# EAGLE schematic apu (EAGLE 9.6.2)
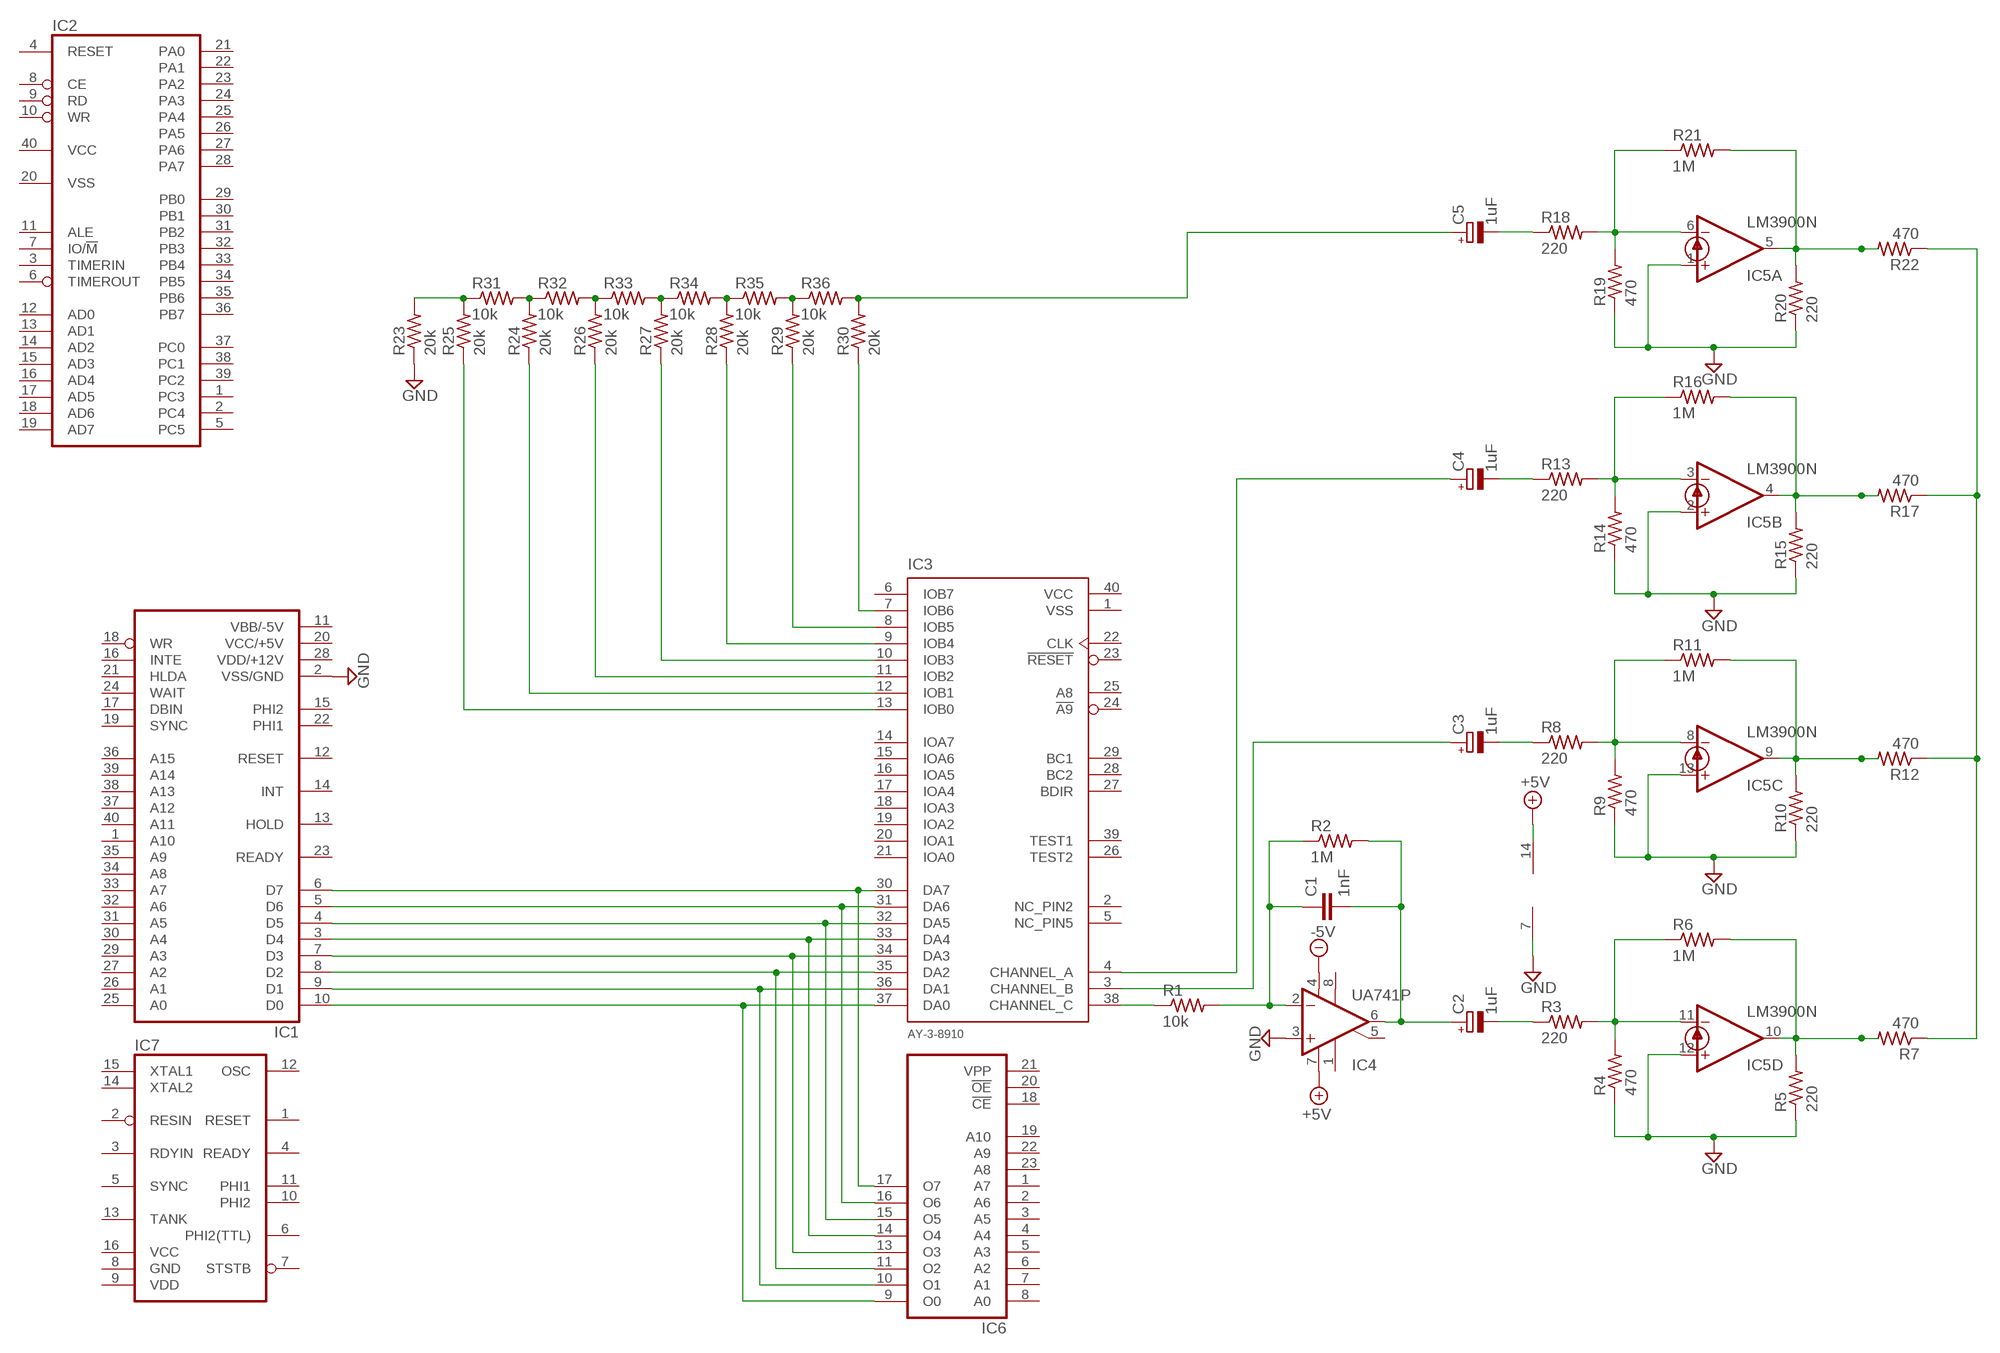
[diagram p0: schematic, sheet 1]

## Parts
C1  1nF  C-EU025-025X050  [C025-025X050]
C2  1uF  CPOL-EUE1.8-4  [E1,8-4]
C3  1uF  CPOL-EUE1.8-4  [E1,8-4]
C4  1uF  CPOL-EUE1.8-4  [E1,8-4]
C5  1uF  CPOL-EUE1.8-4  [E1,8-4]
IC1  8080  [DIL40]
IC2  8155  [DIL40]
IC3  AY-3-8910  [DIL40]
IC4  UA741P  [DIL08]
IC5  LM3900N  [DIL14]
IC6  2716  [DIL24]
IC7  8224  [DIL16]
R1  10k  R-US_0207/10  [0207/10]
R2  1M  R-US_0207/10  [0207/10]
R3  220  R-US_0207/10  [0207/10]
R4  470  R-US_0207/10  [0207/10]
R5  220  R-US_0207/10  [0207/10]
R6  1M  R-US_0207/10  [0207/10]
R7  470  R-US_0207/10  [0207/10]
R8  220  R-US_0207/10  [0207/10]
R9  470  R-US_0207/10  [0207/10]
R10  220  R-US_0207/10  [0207/10]
R11  1M  R-US_0207/10  [0207/10]
R12  470  R-US_0207/10  [0207/10]
R13  220  R-US_0207/10  [0207/10]
R14  470  R-US_0207/10  [0207/10]
R15  220  R-US_0207/10  [0207/10]
R16  1M  R-US_0207/10  [0207/10]
R17  470  R-US_0207/10  [0207/10]
R18  220  R-US_0207/10  [0207/10]
R19  470  R-US_0207/10  [0207/10]
R20  220  R-US_0207/10  [0207/10]
R21  1M  R-US_0207/10  [0207/10]
R22  470  R-US_0207/10  [0207/10]
R23  20k  R-US_0207/10  [0207/10]
R24  20k  R-US_0207/10  [0207/10]
R25  20k  R-US_0207/10  [0207/10]
R26  20k  R-US_0207/10  [0207/10]
R27  20k  R-US_0207/10  [0207/10]
R28  20k  R-US_0207/10  [0207/10]
R29  20k  R-US_0207/10  [0207/10]
R30  20k  R-US_0207/10  [0207/10]
R31  10k  R-US_0207/10  [0207/10]
R32  10k  R-US_0207/10  [0207/10]
R33  10k  R-US_0207/10  [0207/10]
R34  10k  R-US_0207/10  [0207/10]
R35  10k  R-US_0207/10  [0207/10]
R36  10k  R-US_0207/10  [0207/10]

## Nets
+5V: IC4.7(V+) IC5.14(P:V+)
-5V: IC4.4(V-)
GND: IC1.2(VSS/GND) IC4.3(+IN) IC5.1(A:+IN) IC5.2(B:+IN) IC5.7(P:GND) IC5.12(D:+IN) IC5.13(C:+IN) R4.1 R5.1 R9.1 R10.1 R14.1 R15.1 R19.1 R20.1 R23.1
N$1: C1.1 IC4.2(-IN) R1.2 R2.1
N$2: IC3.38(CHANNEL_C) R1.1
N$3: C1.2 C2.+ IC4.6(OUT) R2.2
N$4: C2.- R3.1
N$5: IC5.11(D:-IN) R3.2 R4.2 R6.1
N$6: C3.- R8.1
N$7: IC5.10(D:OUT) R5.2 R6.2 R7.2
N$8: IC5.8(C:-IN) R8.2 R9.2 R11.1
N$9: IC5.9(C:OUT) R10.2 R11.2 R12.2
N$10: C4.- R13.1
N$11: IC5.3(B:-IN) R13.2 R14.2 R16.1
N$12: IC5.4(B:OUT) R15.2 R16.2 R17.2
N$13: C5.- R18.1
N$14: IC5.6(A:-IN) R18.2 R19.2 R21.1
N$15: IC5.5(A:OUT) R20.2 R21.2 R22.2
N$16: C3.+ IC3.3(CHANNEL_B)
N$17: R23.2 R25.2 R31.1
N$18: C4.+ IC3.4(CHANNEL_A)
N$19: R7.1 R12.1 R17.1 R22.1
N$20: IC3.13(IOB0) R25.1
N$21: R24.2 R31.2 R32.1
N$22: R26.2 R32.2 R33.1
N$23: R27.2 R33.2 R34.1
N$24: R28.2 R34.2 R35.1
N$25: R29.2 R35.2 R36.1
N$31: IC1.10(D0) IC3.37(DA0) IC6.9(O0)
N$32: C5.+ R30.2 R36.2
N$33: IC3.12(IOB1) R24.1
N$34: IC3.11(IOB2) R26.1
N$35: IC3.10(IOB3) R27.1
N$36: IC3.9(IOB4) R28.1
N$37: IC3.8(IOB5) R29.1
N$38: IC3.7(IOB6) R30.1
N$39: IC1.9(D1) IC3.36(DA1) IC6.10(O1)
N$40: IC1.8(D2) IC3.35(DA2) IC6.11(O2)
N$41: IC1.7(D3) IC3.34(DA3) IC6.13(O3)
N$42: IC1.3(D4) IC3.33(DA4) IC6.14(O4)
N$43: IC1.4(D5) IC3.32(DA5) IC6.15(O5)
N$44: IC1.5(D6) IC3.31(DA6) IC6.16(O6)
N$45: IC1.6(D7) IC3.30(DA7) IC6.17(O7)
Unconnected: IC1.1(A10) IC1.12(RESET) IC1.13(HOLD) IC1.14(INT) IC1.15(PHI2) IC1.16(INTE) IC1.17(DBIN) IC1.18(WR) IC1.19(SYNC) IC1.21(HLDA) IC1.22(PHI1) IC1.23(READY) IC1.24(WAIT) IC1.25(A0) IC1.26(A1) IC1.27(A2) IC1.29(A3) IC1.30(A4) IC1.31(A5) IC1.32(A6) IC1.33(A7) IC1.34(A8) IC1.35(A9) IC1.36(A15) IC1.37(A12) IC1.38(A13) IC1.39(A14) IC1.40(A11) IC2.1(PC3) IC2.2(PC4) IC2.3(TIMERIN) IC2.4(RESET) IC2.5(PC5) IC2.6(TIMEROUT) IC2.7(IO/!M) IC2.8(CE) IC2.9(RD) IC2.10(WR) IC2.11(ALE) IC2.12(AD0) IC2.13(AD1) IC2.14(AD2) IC2.15(AD3) IC2.16(AD4) IC2.17(AD5) IC2.18(AD6) IC2.19(AD7) IC2.21(PA0) IC2.22(PA1) IC2.23(PA2) IC2.24(PA3) IC2.25(PA4) IC2.26(PA5) IC2.27(PA6) IC2.28(PA7) IC2.29(PB0) IC2.30(PB1) IC2.31(PB2) IC2.32(PB3) IC2.33(PB4) IC2.34(PB5) IC2.35(PB6) IC2.36(PB7) IC2.37(PC0) IC2.38(PC1) IC2.39(PC2) IC3.2(NC_PIN2) IC3.5(NC_PIN5) IC3.6(IOB7) IC3.14(IOA7) IC3.15(IOA6) IC3.16(IOA5) IC3.17(IOA4) IC3.18(IOA3) IC3.19(IOA2) IC3.20(IOA1) IC3.21(IOA0) IC3.22(CLK) IC3.23(!RESET) IC3.24(!A9) IC3.25(A8) IC3.26(TEST2) IC3.27(BDIR) IC3.28(BC2) IC3.29(BC1) IC3.39(TEST1) IC4.1(ON1) IC4.5(ON2) IC4.8(OPT) IC6.1(A7) IC6.2(A6) IC6.3(A5) IC6.4(A4) IC6.5(A3) IC6.6(A2) IC6.7(A1) IC6.8(A0) IC6.18(!CE) IC6.19(A10) IC6.20(!OE) IC6.21(VPP) IC6.22(A9) IC6.23(A8) IC7.1(RESET) IC7.2(RESIN) IC7.3(RDYIN) IC7.4(READY) IC7.5(SYNC) IC7.6(PHI2(TTL)) IC7.7(STSTB) IC7.10(PHI2) IC7.11(PHI1) IC7.12(OSC) IC7.13(TANK) IC7.14(XTAL2) IC7.15(XTAL1)

## Power pins joined to a net without a drawn wire
GND: IC6.12(GND) IC7.8(GND)
VBB/-5V: IC1.11(VBB/-5V)
VCC: IC2.40(VCC) IC3.40(VCC) IC6.24(VCC) IC7.16(VCC)
VCC/+5V: IC1.20(VCC/+5V)
VDD: IC7.9(VDD)
VDD/+12V: IC1.28(VDD/+12V)
VSS: IC2.20(VSS) IC3.1(VSS)

## Library data of the parts
C1 = rcl:C-EU: CAPACITOR, European symbol; SPICEPREFIX: C
C2-C5 = rcl:CPOL-EU: POLARIZED CAPACITOR, European symbol; SPICEPREFIX: C
IC1 = micro-intel:8080: MICROCOMPUTER/PERIPHERAL DEVICE; OC_FARNELL: unknown; OC_NEWARK: unknown
IC2 = micro-intel:8155: MICROCOMPUTER/PERIPHERAL DEVICE; OC_FARNELL: unknown; OC_NEWARK: unknown
IC3 = 8Bit_Parts:AY-3-8910
IC4 = linear:*741: OP AMP
IC5 = linear:LM3900: OP AMP
IC6 = memory:2716: MEMORY
IC7 = micro-intel:8224: MICROCOMPUTER/PERIPHERAL DEVICE; OC_FARNELL: unknown; OC_NEWARK: unknown
R1-R36 = rcl:R-US_: RESISTOR, American symbol; SPICEPREFIX: R